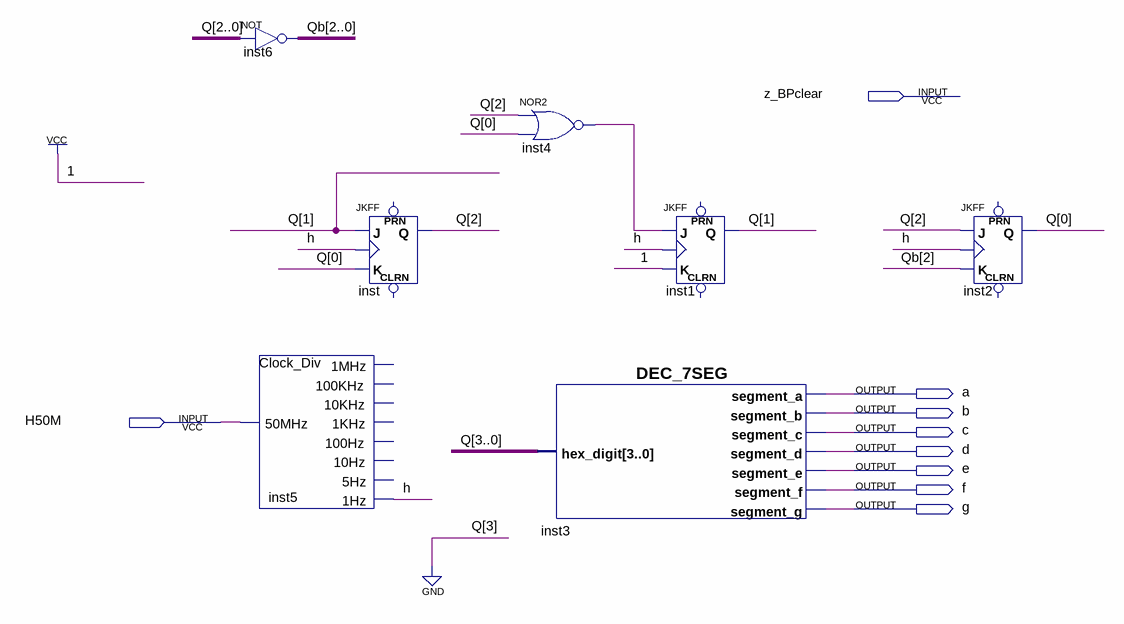
[diagram p0: schematic sheet]
// Quartus schematic C_3_jk.bdf as structural Verilog: 7 symbols, 9 pins
module C_3_jk (
  input  z_BPclear,
  input  H50M,
  output a,
  output b,
  output c,
  output d,
  output e,
  output f,
  output g
);

  wire h, inst4_out;
  wire [2:0] Q, Qb;

  assign Qb = ~Q;  // NOT inst6, 3 bits wide
  Clock_Div inst5 (.\50MHz (H50M), .\1Hz (h));  // open: 1MHz, 100KHz, 10KHz, 1KHz, 100Hz, 10Hz, 5Hz
  JKFF inst (.K(Q[0]), .J(Q[1]), .CLK(h), .Q(Q[2]));  // open: PRN, CLRN
  nor inst4 (inst4_out, Q[2], Q[0]);
  DEC_7SEG inst3 (
    .hex_digit({1'b0, Q}), .segment_a(a), .segment_b(b), .segment_c(c), .segment_d(d), .segment_e(e),
    .segment_f(f), .segment_g(g));
  JKFF inst1 (.K(1'b1), .J(inst4_out), .CLK(h), .Q(Q[1]));  // open: PRN, CLRN
  JKFF inst2 (.K(Qb[2]), .J(Q[2]), .CLK(h), .Q(Q[0]));  // open: PRN, CLRN
endmodule
